# Altium schematic sheet Top_Sheet.SchDoc
size A4
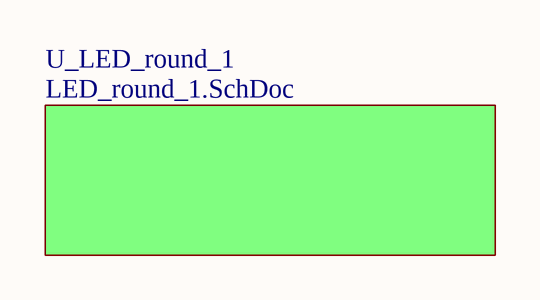
[diagram p0: Top_Sheet.SchDoc]

## Sub-sheets
U_LED_round_1 = LED_round_1.SchDoc: no entries